# Altium project OK0110_Motorized_Door_Lock_V2.0.PrjPCB
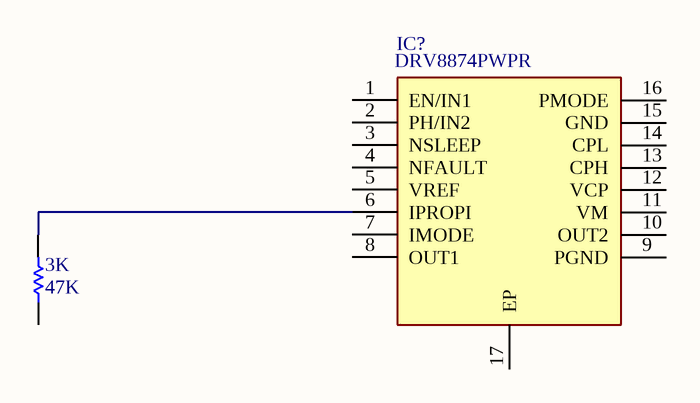
[diagram p0: Motor_Driver.SchDoc]
PRJ_Engineer: Burak YALIM; PRJ_Name: Smart Bluetooth Gateway; PRJ_Revision: V1.0; VariantName: BLE
7 sheets, 104 parts. Net scope: flat (ports and power ports of the same name join across sheets).
Board file: OK0110_Motorized_Door_Lock_V2.0.PcbDoc
Sheets:
  MCU.SchDoc
  Motor_Driver.SchDoc
  Power.SchDoc
  RF_Tranceiver_433.SchDoc
  TOP.SchDoc
  Touch.SchDoc
  Voice.SchDoc

## Sheet MCU.SchDoc
size A3

## Sheet Motor_Driver.SchDoc
size A3

### Parts
3K  value 47K  [RES_0603]  (hidden comment: RES)
IC?  DRV8874PWPR  [SOP65P640X120-17N]

### Nets
Net3K_2: 3K.2 IC?.6(IPROPI)

Not connected (* = marked no-connect by the designer): 3K 1; IC? 1(EN/IN1) 2(PH/IN2) 3(NSLEEP) 4(NFAULT) 5(VREF) 7(IMODE) 8(OUT1) 9(PGND) 10(OUT2) 11(VM) 12(VCP) 13(CPH) 14(CPL) 15(GND) 16(PMODE) 17(EP)

### Library data of the parts
3K = R03000: RES 0603 47K Ohms 1% 1/10W-S 100PPM; Manufacturer: ROYALOHM; Manufacturer Part Number: 0603SAF4702T5E
IC? = DRV8874PWPR: Integrated Circuit; Manufacturer_Name: Texas Instruments; Datasheet Link: https://www.ti.com/lit/gpn/DRV8874; Height: 1.2mm; Manufacturer_Part_Number: DRV8874PWPR; Mouser Part Number: 595-DRV8874PWPR; Mouser Price/Stock: https://www.mouser.co.uk/ProductDetail/Texas-Instruments/DRV8874PWPR?qs=mAH9sUMRCtvh%2FSU15ywmDA%3D%3D; Arrow Part Number: DRV8874PWPR; Arrow Price/Stock: https://www.arrow.com/en/products/drv8874pwpr/texas-instruments.html?utm_currency=USD&region=nac

## Sheet Power.SchDoc
size A3

## Sheet RF_Tranceiver_433.SchDoc
size A3
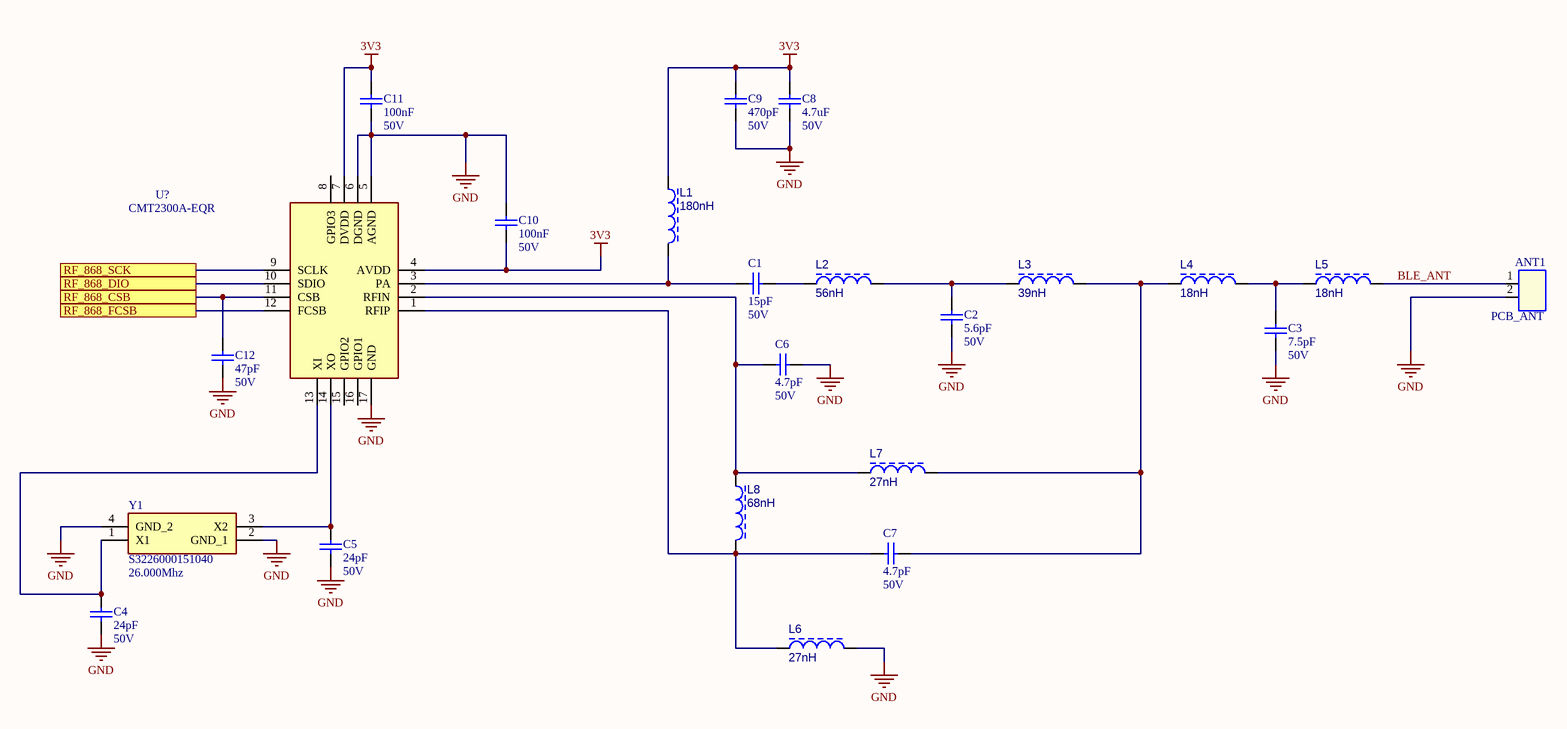
[diagram p1: RF_Tranceiver_433.SchDoc]

### Parts
(Parts that share a designator on the sheet are numbered #1, #2 ... from top to bottom, then left to right.)
ANT1  PCB_ANT  [MINI-ANT-TYPEB]  (no BOM)
C1#1  value 15pF  Voltage: 50V  [CAP_0603]  (hidden comment: CAP)
C2#1  value 5.6pF  Voltage: 50V  [CAP_0603]  (hidden comment: CAP)
C3#1  value 7.5pF  Voltage: 50V  [CAP_0603]  (hidden comment: CAP)
C4#1  value 24pF  Voltage: 50V  [CAP_0603]  (hidden comment: CAP)
C5#1  value 24pF  Voltage: 50V  [CAP_0603]  (hidden comment: CAP)
C6#1  value 4.7pF  Voltage: 50V  [CAP_0603]  (hidden comment: CAP)
C7#1  value 4.7pF  Voltage: 50V  [CAP_0603]  (hidden comment: CAP)
C8#1  value 4.7uF  Voltage: 50V  [CAP_0603]  (hidden comment: CAP)
C9  value 470pF  Voltage: 50V  [CAP_0603]  (hidden comment: CAP)
C10  value 100nF  Voltage: 50V  [CAP_0603]  (hidden comment: CAP)
C11#1  value 100nF  Voltage: 50V  [CAP_0603]  (hidden comment: CAP)
C12  value 47pF  Voltage: 50V  [CAP_0603]  (hidden comment: CAP)
L1  value 180nH  [RES_0603]  (hidden comment: BLM18AG102SN1D)
L2  value 56nH  [RES_0603]  (hidden comment: BLM18AG102SN1D)
L3  value 39nH  [RES_0603]  (hidden comment: BLM18AG102SN1D)
L4  value 18nH  [RES_0603]  (hidden comment: BLM18AG102SN1D)
L5  value 18nH  [RES_0603]  (hidden comment: BLM18AG102SN1D)
L6  value 27nH  [RES_0603]  (hidden comment: BLM18AG102SN1D)
L7  value 27nH  [RES_0603]  (hidden comment: BLM18AG102SN1D)
L8  value 68nH  [RES_0603]  (hidden comment: BLM18AG102SN1D)
U?#1  CMT2300A-EQR  [QFN50P300X300X80-17N-D]
Y1  S3226000151040  value 26.000Mhz  [ABM810000MHZ12D2W]

### Ports
RF_868_CSB, RF_868_DIO, RF_868_FCSB, RF_868_SCK

### Nets
3V3: C8#1.1 C9.1 C10.2 C11#1.1 L1.1 U?#1.4(AVDD) U?#1.7(DVDD)
GND: ANT1.2 C2#1.2 C3#1.2 C4#1.2 C5#1.2 C6#1.2 C8#1.2 C9.2 C10.1 C11#1.2 C12.2 L6.2 U?#1.5(AGND) U?#1.6(DGND) U?#1.17(GND) Y1.2(GND_1) Y1.4(GND_2)
BLE_ANT: ANT1.1 L5.2
NetC1#1_1: C1#1.1 L2.1
NetC1#1_2: C1#1.2 L1.2 U?#1.3(PA)
NetC2#1_1: C2#1.1 L2.2 L3.1
NetC3#1_1: C3#1.1 L4.2 L5.1
NetC4#1_1: C4#1.1 U?#1.13(XI) Y1.1(X1)
NetC5#1_1: C5#1.1 U?#1.14(XO) Y1.3(X2)
NetC6#1_1: C6#1.1 L7.1 L8.1 U?#1.2(RFIN)
NetC7#1_1: C7#1.1 L6.1 L8.2 U?#1.1(RFIP)
NetC7#1_2: C7#1.2 L3.2 L4.1 L7.2
NetC12_1: C12.1 U?#1.11(CSB) ; port RF_868_CSB
NetU?#1_9: U?#1.9(SCLK) ; port RF_868_SCK
NetU?#1_10: U?#1.10(SDIO) ; port RF_868_DIO
NetU?#1_12: U?#1.12(FCSB) ; port RF_868_FCSB

Not connected (* = marked no-connect by the designer): U?#1 8(GPIO3) 15(GPIO2) 16(GPIO1)

### Library data of the parts
C1#1 C2#1 C3#1 C4#1 C5#1 C6#1 C7#1 C8#1 C9 C10 C11#1 C12 = C01763: CAP CER 100nF 50VDC %10 X7R SMD; Manufacturer: Samsung; Manufacturer Part Number: CL10B104KB8NNNL
L1-L8 = BLM18AG102SN1D: FERRITE BEAD 0603 1K 400MA MURATA; Package: 0603 (1608 Metric); Manufacturer: MURATA; Manufacturer Part Number: BLM18AG102SN1D; Supplier Part Number 1: BLM18AG102SN1D; Supplier Part Number 2: 490-1015-2-ND; Supplier Part Number 3: 81-BLM11A102S; Supplier 1: OZDISAN; Supplier 2: DIGIKEY; Supplier 3: MOUSER
U?#1 = CMT2300A: Ultra-low-power Sub-1GHz RF transceiver; Manufacturer_Name: Hope Microelectronics; Datasheet Link: http://www.cmostek.com/download/CMT2300A-CN-Rev0.7.pdf; Height: 0.8mm; Manufacturer_Part_Number: CMT2300A-EQR
Y1 = ABM8-26.000MHZ-10-1-U-T: CRYSTAL 26MHz 15pF SMD; Manufacturer_Name: JGHC; Datasheet Link: https://abracon.com/Resonators/abm8.pdf; Manufacturer_Part_Number: S3226000151040; Mouser Part Number: 815-ABM8-26-T; Mouser Price/Stock: https://www.mouser.co.uk/ProductDetail/ABRACON/ABM8-26.000MHZ-10-1-U-T?qs=76dmnhCH%2FMP1JRP6EvWbSw%3D%3D; Arrow Part Number: ABM8-26.000MHZ-10-1-U-T; Arrow Price/Stock: https://www.arrow.com/en/products/abm8-26.000mhz-10-1-u-t/abracon?utm_currency=USD&region=nac

## Sheet TOP.SchDoc
size A3
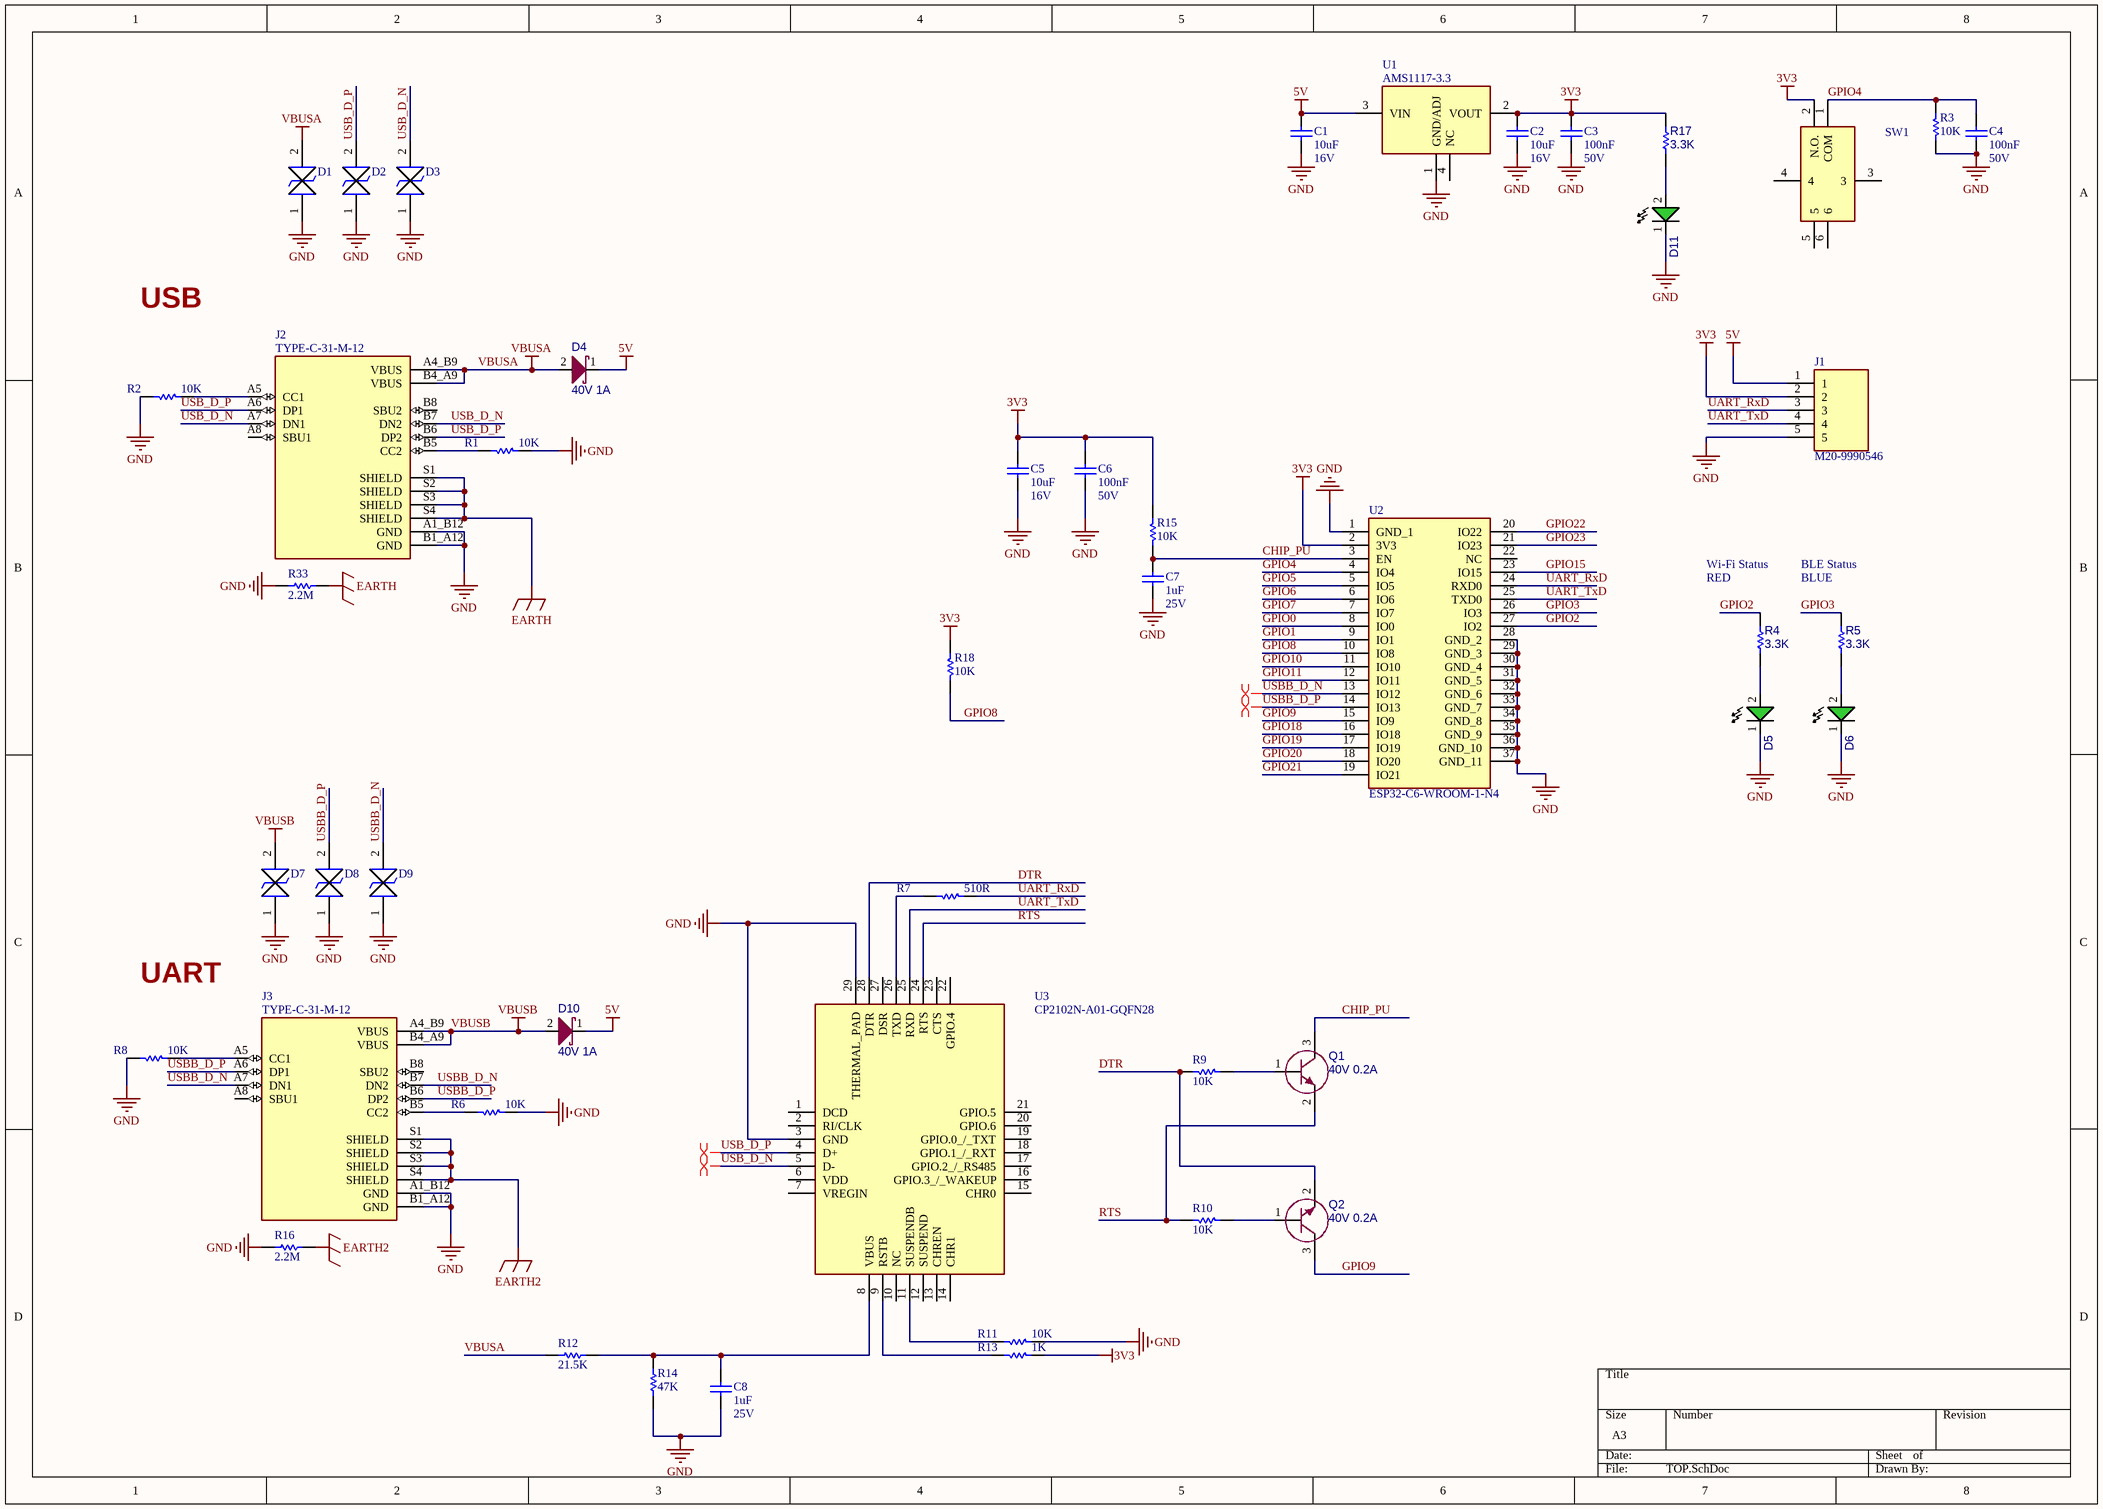
[diagram p2: TOP.SchDoc]

### Parts
(Parts that share a designator on the sheet are numbered #1, #2 ... from top to bottom, then left to right.)
C1#2  value 10uF  Voltage: 16V  [CAP_0805]  (hidden comment: CAP)
C2#2  value 10uF  Voltage: 16V  [CAP_0805]  (hidden comment: CAP)
C3#2  value 100nF  Voltage: 50V  [CAP_0603]  (hidden comment: CAP)
C4#2  value 100nF  Voltage: 50V  [CAP_0603]  (hidden comment: CAP)
C5#2  value 10uF  Voltage: 16V  [CAP_0805]  (hidden comment: CAP)
C6#2  value 100nF  Voltage: 50V  [CAP_0603]  (hidden comment: CAP)
C7#2  value 1uF  Voltage: 25V  [CAP_0603]  (hidden comment: CL10A105KA8NNNC)
C8#2  value 1uF  Voltage: 25V  [CAP_0603]  (hidden comment: CL10A105KA8NNNC)
D1  ATV02W5V0B-HF  [SODFL3718X130N]  (value not drawn)
D2  ATV02W5V0B-HF  [SODFL3718X130N]  (value not drawn)
D3  ATV02W5V0B-HF  [SODFL3718X130N]  (value not drawn)
D4  value 40V 1A  [SOD-123]  (hidden comment: PMEG4010EGWJ)
D5  HL-PT-1608S52FC-L  [LED_0603_GRN]  (value not drawn)
D6  HL-PT-1608H392BC-L  [LED_0603_GRN]  (value not drawn)
D7  ATV02W5V0B-HF  [SODFL3718X130N]  (value not drawn)
D8  ATV02W5V0B-HF  [SODFL3718X130N]  (value not drawn)
D9  ATV02W5V0B-HF  [SODFL3718X130N]  (value not drawn)
D10  value 40V 1A  [SOD-123]  (hidden comment: PMEG4010EGWJ)
D11  PSC-1608U52GC-G4  [LED_0603_GRN]  (value not drawn)
J1  M20-9990546  [HDRV5W64P0X254_1X5_1270X254X864P]  (no BOM)
J2  TYPE-C-31-M-12  [HRO_TYPE-C-31-M-12]
J3  TYPE-C-31-M-12  [HRO_TYPE-C-31-M-12]
Q1  value 40V 0.2A  [SOT23]  (hidden comment: MMBT3904-7-F)
Q2  value 40V 0.2A  [SOT23]  (hidden comment: MMBT3904-7-F)
R1  value 10K  [RES_0603]  (hidden comment: RES)
R2  value 10K  [RES_0603]  (hidden comment: RES)
R3  value 10K  [RES_0603]  (hidden comment: RES)
R4  value 3.3K  [RES_0603]  (hidden comment: 0603SAF3301T5E)
R5  value 3.3K  [RES_0603]  (hidden comment: 0603SAF3301T5E)
R6  value 10K  [RES_0603]  (hidden comment: RES)
R7  value 510R  [R0603]  (hidden comment: 0603SAJ0511T5E)
R8  value 10K  [RES_0603]  (hidden comment: RES)
R9  value 10K  [RES_0603]  (hidden comment: RES)
R10  value 10K  [RES_0603]  (hidden comment: RES)
R11  value 10K  [RES_0603]  (hidden comment: RES)
R12  value 21.5K  [RES_0603]  (hidden comment: 0603SAF2152T5E)
R13  value 1K  [RES_0603]  (hidden comment: RES)
R14#1  value 47K  [RES_0603]  (hidden comment: RES)
R15#1  value 10K  [RES_0603]  (hidden comment: RES)
R16#1  value 2.2M  [RES_0805]  (hidden comment: RES)
R17#1  value 3.3K  [RES_0603]  (hidden comment: 0603SAF3301T5E)
R18  value 10K  [RES_0603]  (hidden comment: RES)
R33  value 2.2M  [RES_0805]  (hidden comment: RES)
SW1  TS32-7-35-BK-B-260-RA-SMT-TR  [TS32735BKB160RAHSMTTR]  (value not drawn)
U1#1  AMS1117-3.3  [SOT229P700X180-4N]
U2  ESP32-C6-WROOM-1-N4  [ESP32C6WROOM1N4]
U3  CP2102N-A01-GQFN28  [QFN50P500X500X80-29N-D]

### Nets
3V3: C2#2.1 C3#2.1 C5#2.1 C6#2.1 J1.2 R13.2 R15#1.2 R17#1.2 R18.2 SW1.2(N.O.) U1#1.2(VOUT) U2.2(3V3)
5V: C1#2.1 D4.1 D10.1 J1.1 U1#1.3(VIN)
EARTH: J2.S1(SHIELD) J2.S2(SHIELD) J2.S3(SHIELD) J2.S4(SHIELD) R33.2
EARTH2: J3.S1(SHIELD) J3.S2(SHIELD) J3.S3(SHIELD) J3.S4(SHIELD) R16#1.2
GND: C1#2.2 C2#2.2 C3#2.2 C4#2.2 C5#2.2 C6#2.2 C7#2.2 C8#2.2 D1.1 D2.1 D3.1 D5.1 D6.1 D7.1 D8.1 D9.1 D11.1 J1.5 J2.A1_B12(GND) J2.B1_A12(GND) J3.A1_B12(GND) J3.B1_A12(GND) R1.2 R2.1 R3.1 R6.2 R8.1 R11.2 R14#1.2 R16#1.1 R33.1 U1#1.1(GND/ADJ) U2.1(GND_1) U2.28(GND_2) U2.29(GND_3) U2.30(GND_4) U2.31(GND_5) U2.32(GND_6) U2.33(GND_7) U2.34(GND_8) U2.35(GND_9) U2.36(GND_10) U2.37(GND_11) U3.3(GND) U3.29(THERMAL_PAD)
VBUSA: D1.2 D4.2 J2.A4_B9(VBUS) J2.B4_A9(VBUS) R12.1
VBUSB: D7.2 D10.2 J3.A4_B9(VBUS) J3.B4_A9(VBUS)
CHIP_PU: C7#2.1 Q1.3(C) R15#1.1 U2.3(EN)
DTR: Q2.2(E) R9.1 U3.28(DTR)
GPIO0: U2.8(IO0)
GPIO1: U2.9(IO1)
GPIO2: R4.2 U2.27(IO2)
GPIO3: R5.2 U2.26(IO3)
GPIO4: C4#2.1 R3.2 SW1.1(COM) U2.4(IO4)
GPIO5: U2.5(IO5)
GPIO6: U2.6(IO6)
GPIO7: U2.7(IO7)
GPIO8: R18.1 U2.10(IO8)
GPIO9: Q2.3(C) U2.15(IO9)
GPIO10: U2.11(IO10)
GPIO11: U2.12(IO11)
GPIO15: U2.23(IO15)
GPIO18: U2.16(IO18)
GPIO19: U2.17(IO19)
GPIO20: U2.18(IO20)
GPIO21: U2.19(IO21)
GPIO22: U2.20(IO22)
GPIO23: U2.21(IO23)
RTS: Q1.2(E) R10.1 U3.24(RTS)
UART_RxD: J1.3 R7.2 U2.24(RXD0)
UART_TxD: J1.4 U2.25(TXD0) U3.25(RXD)
USB_D_N: D3.2 J2.A7(DN1) J2.B7(DN2) U3.5(D-)
USB_D_P: D2.2 J2.A6(DP1) J2.B6(DP2) U3.4(D+)
USBB_D_N: D9.2 J3.A7(DN1) J3.B7(DN2) U2.13(IO12)
USBB_D_P: D8.2 J3.A6(DP1) J3.B6(DP2) U2.14(IO13)
NetC8#2_1: C8#2.1 R12.2 R14#1.1 U3.8(VBUS)
NetD5_2: D5.2 R4.1
NetD6_2: D6.2 R5.1
NetD11_2: D11.2 R17#1.1
NetJ2_A5: J2.A5(CC1) R2.2
NetJ2_B5: J2.B5(CC2) R1.1
NetJ3_A5: J3.A5(CC1) R8.2
NetJ3_B5: J3.B5(CC2) R6.1
NetQ1_1: Q1.1(B) R9.2
NetQ2_1: Q2.1(B) R10.2
NetR7_1: R7.1 U3.26(TXD)
NetR11_1: R11.1 U3.11(SUSPENDB)
NetR13_1: R13.1 U3.9(RSTB)

Not connected (* = marked no-connect by the designer): J2 A8(SBU1) B8(SBU2); J3 A8(SBU1) B8(SBU2); SW1 3 4 5 6; U1#1 4(NC); U2 22(NC); U3 1(DCD) 2(RI/CLK) 6(VDD) 7(VREGIN) 10(NC) 12(SUSPEND) 13(CHREN) 14(CHR1) 15(CHR0) 16(GPIO.3_/_WAKEUP) 17(GPIO.2_/_RS485) 18(GPIO.1_/_RXT) 19(GPIO.0_/_TXT) 20(GPIO.6) 21(GPIO.5) 22(GPIO.4) 23(CTS) 27(DSR)

### Layout directives
differential pair; differential pair class USBA: USB_D_N, USB_D_P
differential pair; differential pair class USBB; rule Impedance Constraint [Min = 98.00    Max = 102.0    ]: USBB_D_N, USBB_D_P

### Notes on the sheet
- USB
- Wi-Fi Status
- RED
- BLE Status
- BLUE
- UART

### Library data of the parts
C1#2 C2#2 C5#2 = C01758: CAP CER 10UF 16VDC %10 X5R SMD; Manufacturer: Samsung; Manufacturer Part Number: CL21A106KOQNNNE
C3#2 C4#2 C6#2 = C01763: as C1#1 on sheet RF_Tranceiver_433
C7#2 C8#2 = C01757: CAP CER 1UF 25VDC %10 X5R SMD; Manufacturer: Samsung; Manufacturer Part Number: CL10A105KA8NNNC
D1-D3 D7-D9 = ATV02W5V0B-HF: 9.2V Clamp 21.74A Ipp Tvs Diode Surface Mount SOD-123F; Manufacturer: Comchip Technology; Manufacturer Part Number: ATV02W5V0B-HF
D4 D10 = PMEG4010EGWJ: DIODE SCHOTTKY 40V 1A SOD123; Manufacturer: Nexperia USA Inc.; Manufacturer Part Number: PMEG4010EGWJ
D5 = LTST-C190TGKT: LED RED WATER CLEAR 0603 SMD; Manufacturer: HONGLITRONIC; Manufacturer Part Number: HL-PT-1608S52FC-L; Value: RED
D6 = LTST-C190TGKT: LED BLUE WATER CLEAR 0603 SMD; Manufacturer: HONGLITRONIC; Manufacturer Part Number: HL-PT-1608H392BC-L; Value: BLUE
D11 = LTST-C190TGKT: LED GREEN WATER CLEAR 0603 SMD; Manufacturer: HONGLITRONIC; Manufacturer Part Number: PSC-1608U52GC-G4; Value: GREEN
J1 = M20-9990546: Connector; Manufacturer_Name: Harwin; Datasheet Link: https://content.harwin.com/m/0df15f6e0f9f48e2/original/DRG-00479-Technical-Drawing-Datasheet-M20-999-pdf.pdf; Height: 8.64mm; Manufacturer_Part_Number: M20-9990546; Mouser Part Number: 855-M20-9990546; Mouser Price/Stock: https://www.mouser.co.uk/ProductDetail/Harwin/M20-9990546?qs=ulE8k0yEMYY8EKyDN9ic6A%3D%3D
J2 J3 = TYPE-C-31-M-12: USB Connectors 24 Receptacle 1 8.94*7.3mm RoHS; Manufacturer: HRO Electronics Co., Ltd.; Value: TYPE-C-31-M-12; Manufacturer Part Number: TYPE-C-31-M-12
Q1 Q2 = MMBT3904-7-F: TRANSISTOR NPN 40V 0.2A SOT23-3; Manufacturer: Diodes Incorporated; Manufacturer Part Number: MMBT3904-7-F
R1-R3 R6 R8-R11 R15#1 R18 = R02995: RES 0603 10k Ohms %1 1/10W 100PPM; Manufacturer: ROYALOHM; Manufacturer Part Number: 0603SAF1002T5E
R4 R5 R17#1 = 0603SAF3301T5E: RES.(1608) 0603 3.3K Ohms 1% 1/10W 100PPM SMT; Manufacturer: YAGEO; Manufacturer Part Number: RC0603FR-073K74L
R7 = R03005: RES.(1608) 0603 510 Ohms 5% 1/10W-S 100PPM; Manufacturer: ROYALOHM; Manufacturer Part Number: 0603SAJ0511T5E
R12 = R03011: RES.(1608) 0603 21.5K Ohms 1% 1/10W-S 100PPM; Manufacturer: ROYALOHM; Manufacturer Part Number: 0603SAF2152T5E
R13 = R02998: RES 0603 1K Ohms 1% 1/10W-S 100PPM; Manufacturer: ROYALOHM; Manufacturer Part Number: 0603SAF1001T5E
R14#1 = R03000: as 3K on sheet Motor_Driver
R16#1 R33 = R01913: RES SMD 2.2M OHM 1% 1/8W 0805; Manufacturer: Yageo; Manufacturer Part Number: RC0805FR-072M2L
SW1 = TS32-7-35-BK-B-260-RA-SMT-TR: Manufacturer: Same Sky; Manufacturer Part Number: TS32-7-35-BK-B-260-RA-SMT-TR
U1#1 = AMS1117-3.3: Linear Voltage Regulator IC Positive Fixed 1 Output 1A SOT-223-3L; Manufacturer: Advanced; Manufacturer Part Number: AMS1117-3.3
U2 = ESP32-C6-WROOM-1-N4: Manufacturer: Espressif Systems; Manufacturer Part Number: ESP32-C6-WROOM-1-N4
U3 = CP2102N-A01-GQFN28: USB Bridge, USB to UART USB 2.0 UART Interface 28-QFN (5x5); Manufacturer: Silicon Labs; Manufacturer Part Number: CP2102N-A01-GQFN28

## Sheet Touch.SchDoc
size A4
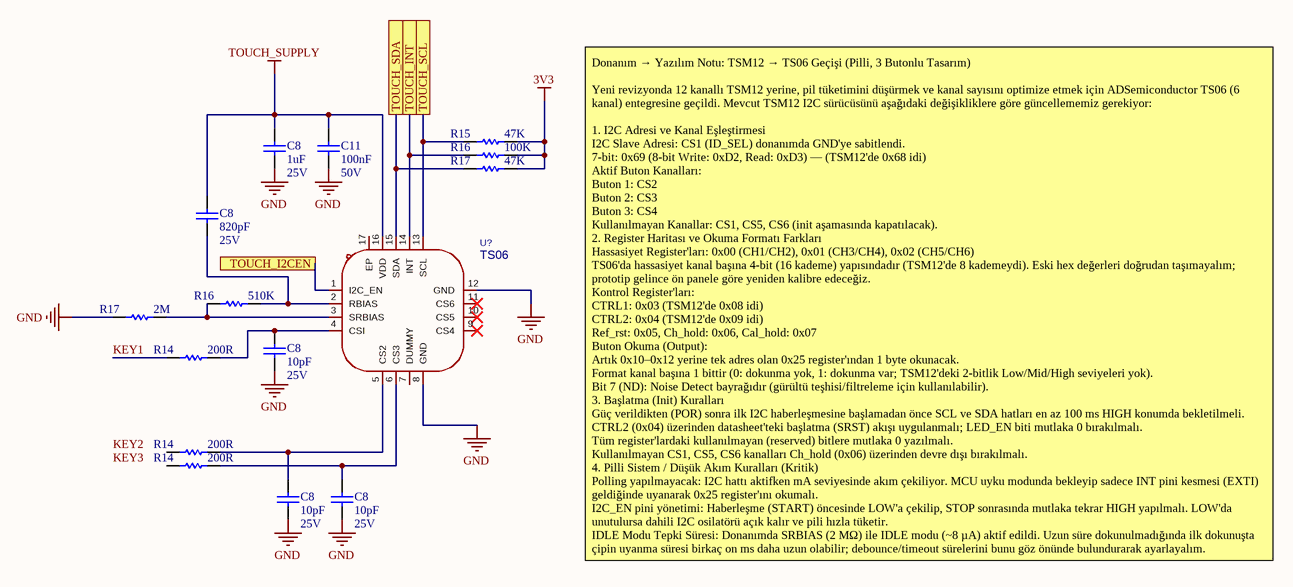
[diagram p3: Touch.SchDoc]

### Parts
(Parts that share a designator on the sheet are numbered #1, #2 ... from top to bottom, then left to right.)
C8#3  value 1uF  Voltage: 25V  [CAP_0603]  (hidden comment: CL10A105KA8NNNC)
C8#4  value 820pF  Voltage: 25V  [CAP_0603]  (hidden comment: CL10A105KA8NNNC)
C8#5  value 10pF  Voltage: 25V  [CAP_0603]  (hidden comment: CL10A105KA8NNNC)
C8#6  value 10pF  Voltage: 25V  [CAP_0603]  (hidden comment: CL10A105KA8NNNC)
C8#7  value 10pF  Voltage: 25V  [CAP_0603]  (hidden comment: CL10A105KA8NNNC)
C11#2  value 100nF  Voltage: 50V  [CAP_0603]  (hidden comment: CAP)
R14#2  value 200R  [RES_0603]  (hidden comment: RES)
R14#3  value 200R  [RES_0603]  (hidden comment: RES)
R14#4  value 200R  [RES_0603]  (hidden comment: RES)
R15#2  value 47K  [RES_0603]  (hidden comment: RES)
R16#2  value 100K  [RES_0603]  (hidden comment: RES)
R16#3  value 510K  [RES_0603]  (hidden comment: RES)
R17#2  value 47K  [RES_0603]  (hidden comment: RES)
R17#3  value 2M  [RES_0603]  (hidden comment: RES)
U?#2  TS06  [QFN-16_L3.0-W3.0-P0.50-BL-EP2.0]

### Ports
TOUCH_I2CEN, TOUCH_INT, TOUCH_SCL, TOUCH_SDA

### Nets
3V3: R15#2.2 R16#2.2 R17#2.2
GND: C8#3.2 C8#5.2 C8#6.2 C8#7.2 C11#2.2 R17#3.1 U?#2.8(GND) U?#2.12(GND)
TOUCH_SUPPLY: C8#3.1 C8#4.1 C11#2.1 U?#2.16(VDD)
KEY1: R14#2.1
NetC8#4_2: C8#4.2 R16#3.2 U?#2.2(RBIAS)
NetC8#5_1: C8#5.1 R14#2.2 U?#2.4(CSI)
NetC8#6_1: C8#6.1 R14#3.2 U?#2.5(CS2)
NetC8#7_1: C8#7.1 R14#4.2 U?#2.6(CS3)
NetR15#2_1: R15#2.1 U?#2.13(SCL) ; port TOUCH_SCL
NetR16#2_1: R16#2.1 U?#2.14(INT) ; port TOUCH_INT
NetR16#3_1: R16#3.1 R17#3.2 U?#2.3(SRBIAS)
NetR17#2_1: R17#2.1 U?#2.15(SDA) ; port TOUCH_SDA
NetU?#2_1: U?#2.1(I2C_EN) ; port TOUCH_I2CEN

Not connected (* = marked no-connect by the designer): R14#3 1; R14#4 1; U?#2 7(DUMMY) 9(CS4)* 10(CS5)* 11(CS6)* 17(EP)

### Notes on the sheet
- Donanım → Yazılım Notu: TSM12 → TS06 Geçişi (Pilli, 3 Butonlu Tasarım)
  Yeni revizyonda 12 kanallı TSM12 yerine, pil tüketimini düşürmek ve kanal sayısını optimize etmek için ADSemiconductor TS06 (6 kanal) entegresine geçildi. Mevcut TSM12 I2C sürücüsünü aşağıdaki değişikliklere göre güncellememiz gerekiyor:
  1. I2C Adresi ve Kanal Eşleştirmesi
  I2C Slave Adresi: CS1 (ID_SEL) donanımda GND'ye sabitlendi.
  7-bit: 0x69 (8-bit Write: 0xD2, Read: 0xD3) — (TSM12'de 0x68 idi)
  Aktif Buton Kanalları:
  Buton 1: CS2
  Buton 2: CS3
  Buton 3: CS4
  Kullanılmayan Kanallar: CS1, CS5, CS6 (init aşamasında kapatılacak).
  2. Register Haritası ve Okuma Formatı Farkları
  Hassasiyet Register'ları: 0x00 (CH1/CH2), 0x01 (CH3/CH4), 0x02 (CH5/CH6)
  TS06'da hassasiyet kanal başına 4-bit (16 kademe) yapısındadır (TSM12'de 8 kademeydi). Eski hex değerleri doğrudan taşımayalım; prototip gelince ön panele göre yeniden kalibre edeceğiz.
  Kontrol Register'ları:
  CTRL1: 0x03 (TSM12'de 0x08 idi)
  CTRL2: 0x04 (TSM12'de 0x09 idi)
  Ref_rst: 0x05, Ch_hold: 0x06, Cal_hold: 0x07
  Buton Okuma (Output):
  Artık 0x10–0x12 yerine tek adres olan 0x25 register'ından 1 byte okunacak.
  Format kanal başına 1 bittir (0: dokunma yok, 1: dokunma var; TSM12'deki 2-bitlik Low/Mid/High seviyeleri yok).
  Bit 7 (ND): Noise Detect bayrağıdır (gürültü teşhisi/filtreleme için kullanılabilir).
  3. Başlatma (Init) Kuralları
  Güç verildikten (POR) sonra ilk I2C haberleşmesine başlamadan önce SCL ve SDA hatları en az 100 ms HIGH konumda bekletilmeli.
  CTRL2 (0x04) üzerinden datasheet'teki başlatma (SRST) akışı uygulanmalı; LED_EN biti mutlaka 0 bırakılmalı.
  Tüm register'lardaki kullanılmayan (reserved) bitlere mutlaka 0 yazılmalı.
  Kullanılmayan CS1, CS5, CS6 kanalları Ch_hold (0x06) üzerinden devre dışı bırakılmalı.
  4. Pilli Sistem / Düşük Akım Kuralları (Kritik)
  Polling yapılmayacak: I2C hattı aktifken mA seviyesinde akım çekiliyor. MCU uyku modunda bekleyip sadece INT pini kesmesi (EXTI) geldiğinde uyanarak 0x25 register'ını okumalı.
  I2C_EN pini yönetimi: Haberleşme (START) öncesinde LOW'a çekilip, STOP sonrasında mutlaka tekrar HIGH yapılmalı. LOW'da unutulursa dahili I2C osilatörü açık kalır ve pili hızla tüketir.
  IDLE Modu Tepki Süresi: Donanımda SRBIAS (2 MΩ) ile IDLE modu (~8 µA) aktif edildi. Uzun süre dokunulmadığında ilk dokunuşta çipin uyanma süresi birkaç on ms daha uzun olabilir; debounce/timeout sürelerini bunu göz önünde bulundurarak ayarlayalım.
- Labels drawn without touching a wire or pin: KEY2, KEY3
- Title
- Size:
- Date:
- A4
- Number:
- Rev.Number:
- Revision:
- Drawer/
- Sheet
- of
- YALIM
- Burak
- TURKEY
- File:

### Library data of the parts
C8#3-C8#7 = C01757: as C7#2 on sheet TOP; Manufacturer Part Number: CL10A105KA8NNNC
C11#2 = C01763: as C1#1 on sheet RF_Tranceiver_433
R14#2-R14#4 R15#2 R16#2 R16#3 R17#2 R17#3 = R03000: as 3K on sheet Motor_Driver
U?#2 = TS06: Number of Channels:6 Features:Capacitive Touch；PWM Control；Automatic sensitivity calibration；Integrated LED driver Whether the Lock:- Voltage - Supply:2.5V~5V Voltage - Supply:2.5V~5V Current - Supply:80uA Operating Temperature:-20℃~+75℃ Operating Tempera; Manufacturer: AD Semiconductor; AddInBom: yes; ModelId: 70b6265379b441acae380b40a6ebf137; ModelName: QFN-16_L3.0-W3.0-P0.50-EP2.0; ModelTransform: 118.8974,118.8974,0,90,0,0,0,0,0; Number of Channels: 6; Current - Supply: 80uA; Standby Current: 8uA; ESD Protection Voltage: 5kV; Symbol: TS06; LCSC Part Name: 6通道自动灵敏度校准电容式触摸传感器; SupplierPart: C132386; ManufacturerPart: TS06; Supplier Footprint: QFN-16-EP(3x3); JLCPCB Part Class: Extended Part; Datasheet: https://item.szlcsc.com/datasheet/TS06/143685.html; Supplier: LCSC; ConvertToPcb: yes; FootprintName: QFN-16_L3.0-W3.0-P0.50-BL-EP2.0; Features: Capacitive Touch；PWM Control；Automatic sensitivity calibration；Integrated LED driver; Whether the Lock: -; Voltage - Supply: 2.5V~5V; Operating Temperature: -20℃~+75℃; Response Time (tr): -

## Sheet Voice.SchDoc
size A4
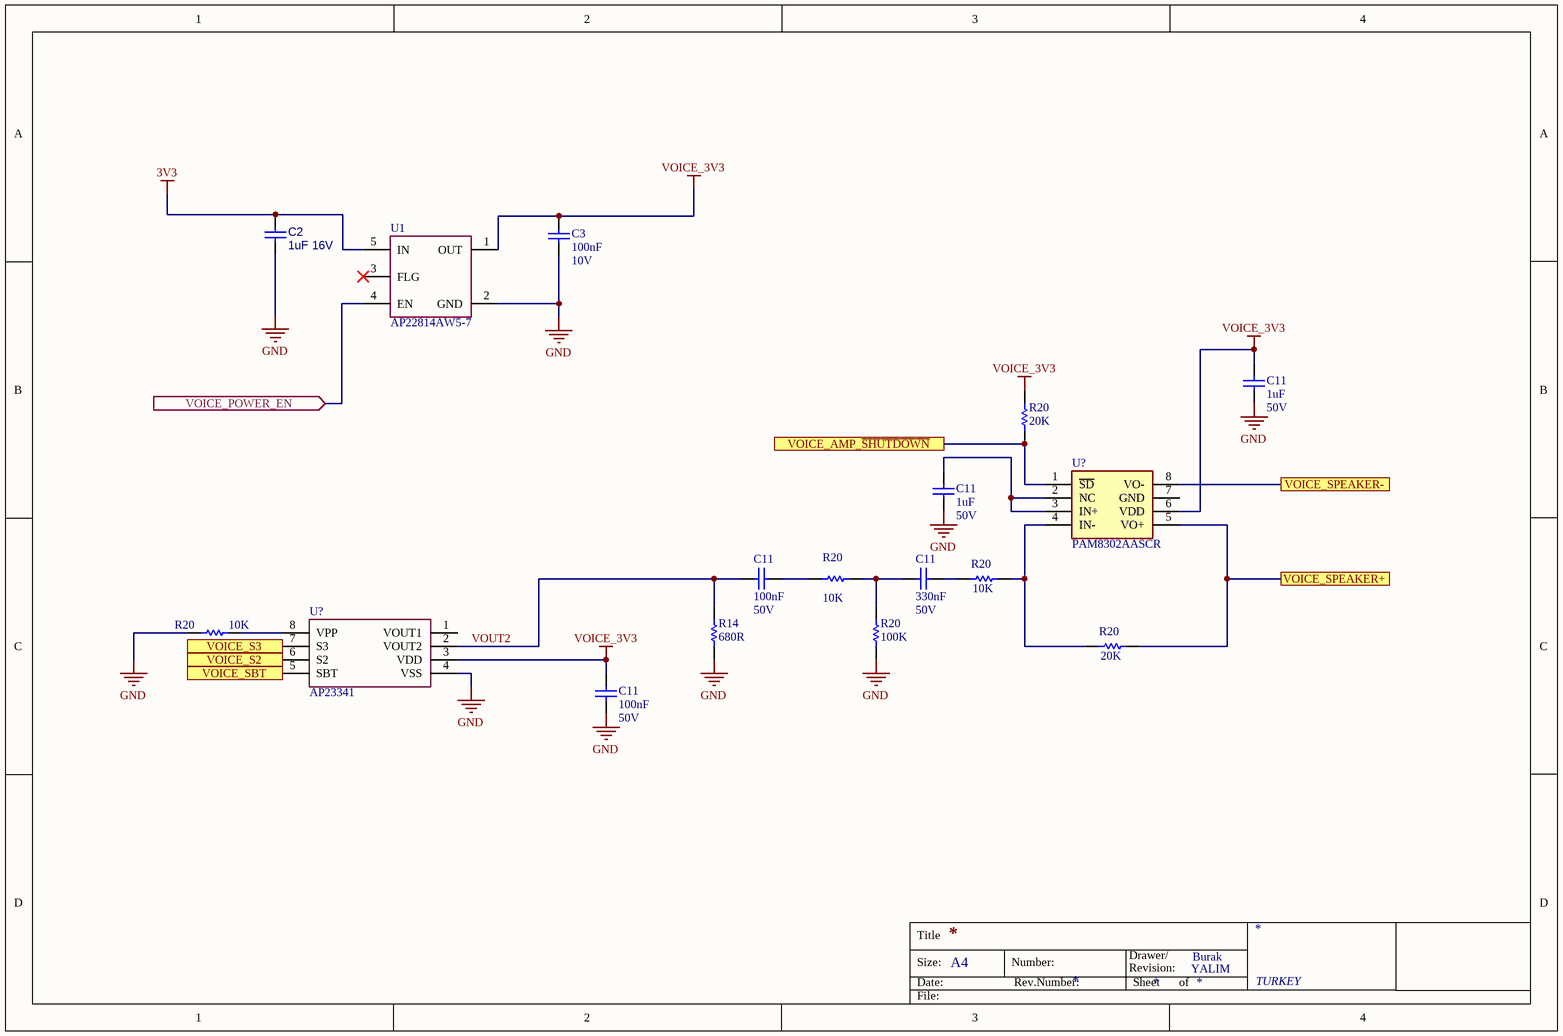
[diagram p4: Voice.SchDoc]

### Parts
(Parts that share a designator on the sheet are numbered #1, #2 ... from top to bottom, then left to right.)
C2#3  value 1uF 16V  [CAP_0603]  (hidden comment: CL10A105KO8NNNC)
C3#3  value 100nF  Voltage: 10V  [CAP_0402]  (hidden comment: CAP)
C11#3  value 1uF  Voltage: 50V  [CAP_0402]  (hidden comment: CAP)
C11#4  value 1uF  Voltage: 50V  [CAP_0402]  (hidden comment: CAP)
C11#5  value 100nF  Voltage: 50V  [CAP_0402]  (hidden comment: CAP)
C11#6  value 330nF  Voltage: 50V  [CAP_0402]  (hidden comment: CAP)
C11#7  value 100nF  Voltage: 50V  [CAP_0402]  (hidden comment: CAP)
R14#5  value 680R  [RES_0402]  (hidden comment: RES)
R20#1  value 20K  [RES_0402]  (hidden comment: RES)
R20#2  value 10K  [RES_0402]  (hidden comment: RES)
R20#3  value 10K  [RES_0402]  (hidden comment: RES)
R20#4  value 100K  [RES_0402]  (hidden comment: RES)
R20#5  value 10K  [RES_0402]  (hidden comment: RES)
R20#6  value 20K  [RES_0402]  (hidden comment: RES)
U1#2  AP22814AW5-7  [SOT95P285X140-5N]
U?#3  PAM8302AASCR  [SOP65P490X110-8N]
U?#4  AP23341  [SO-8]

### Ports
VOICE_AMP_~{SHUTDOWN}, VOICE_POWER_EN (in), VOICE_S2, VOICE_S3, VOICE_SBT, VOICE_SPEAKER+, VOICE_SPEAKER-

### Nets
3V3: C2#3.1 U1#2.5(IN)
GND: C2#3.2 C3#3.1 C11#3.2 C11#4.2 C11#7.2 R14#5.1 R20#4.2 R20#5.2 U1#2.2(GND) U?#4.4(VSS)
VOICE_3V3: C3#3.2 C11#3.1 C11#7.1 R20#1.1 U1#2.1(OUT) U?#3.6(VDD) U?#4.3(VDD)
VOUT2: C11#5.1 R14#5.2 U?#4.2(VOUT2)
NetC11#4_1: C11#4.1 U?#3.2(NC) U?#3.3(IN+)
NetC11#5_2: C11#5.2 R20#2.2
NetC11#6_1: C11#6.1 R20#2.1 R20#4.1
NetC11#6_2: C11#6.2 R20#3.2
NetR20#1_2: R20#1.2 U?#3.1(~{SD}) ; port VOICE_AMP_~{SHUTDOWN}
NetR20#3_1: R20#3.1 R20#6.2 U?#3.4(IN-)
NetR20#5_1: R20#5.1 U?#4.8(VPP)
NetR20#6_1: R20#6.1 U?#3.5(VO+) ; port VOICE_SPEAKER+
NetU1#2_4: U1#2.4(EN) ; port VOICE_POWER_EN
NetU?#3_8: U?#3.8(VO-) ; port VOICE_SPEAKER-
NetU?#4_5: U?#4.5(SBT) ; port VOICE_SBT
NetU?#4_6: U?#4.6(S2) ; port VOICE_S2
NetU?#4_7: U?#4.7(S3) ; port VOICE_S3

Not connected (* = marked no-connect by the designer): U1#2 3(FLG)*; U?#3 7(GND); U?#4 1(VOUT1)

### Notes on the sheet
- Title
- Size:
- Date:
- A4
- Number:
- Rev.Number:
- Revision:
- Drawer/
- Sheet
- of
- YALIM
- Burak
- TURKEY
- File:

### Library data of the parts
C2#3 = CL10A105KO8NNNC: MLCC (1608) 0603 1uF 16VDC ±10% X5R; Manufacturer: SAMSUNG; Package: 0603 (1608 Metric); Manufacturer Part Number: CL10A105KO8NNNC; Supplier Part Number 1: CL10A105KO8NNNC; Supplier Part Number 2: 1276-1034-2-ND; Supplier Part Number 3: 187-CL10A105KO8NNNC; Supplier 1: OZDISAN; Supplier 2: DIGIKEY; Supplier 3: MOUSER
C3#3 = C01794: MLCC (1005) 0402 100nF 10VDC ±10% X7R; Manufacturer: Samsung; Manufacturer Part Number: CL05B104KP5NNNC
C11#3-C11#7 = C01763: as C1#1 on sheet RF_Tranceiver_433
R14#5 = R03000: as 3K on sheet Motor_Driver
R20#1-R20#6 = R02995: as R1 on sheet TOP
U1#2 = AP22814AW5-7: IC PWR SWITCH P-CHAN 1:1 SOT25; Manufacturer: Diodes Incorporated; Manufacturer Part Number: AP22814AW5-7
U?#3 = PAM8302AASCR: IC-8302 AMPLIFIER CLASS D 8-MSOP; Manufacturer_Name: Diodes Incorporated; Datasheet Link: https://www.diodes.com/assets/Datasheets/PAM8302A.pdf; Height: 1.1mm; Manufacturer_Part_Number: PAM8302AASCR; Mouser Part Number: 621-PAM8302AASCR; Mouser Price/Stock: https://www.mouser.co.uk/ProductDetail/Diodes-Incorporated/PAM8302AASCR?qs=pYVYkI7xuRXTVZEQSGcDyg%3D%3D; Arrow Part Number: PAM8302AASCR; Arrow Price/Stock: https://www.arrow.com/en/products/pam8302aascr/diodes-incorporated?utm_currency=USD&region=nac
U?#4 = AP23341: IC-AP23341 VOICE OPT. SOP8 SMD; Manufacturer: APLUS Inc; Manufacturer Part Number: AP23341

## Nets that join several sheets
3V3: RF_Tranceiver_433 (7 pins), TOP (12 pins), Touch (R15#2.2 R16#2.2 R17#2.2), Voice (C2#3.1 U1#2.5)
GND: RF_Tranceiver_433 (17 pins), TOP (45 pins), Touch (8 pins), Voice (10 pins)